# Altium schematic sheet NFC_Sheet.SchDoc
size 420 x 297 mm
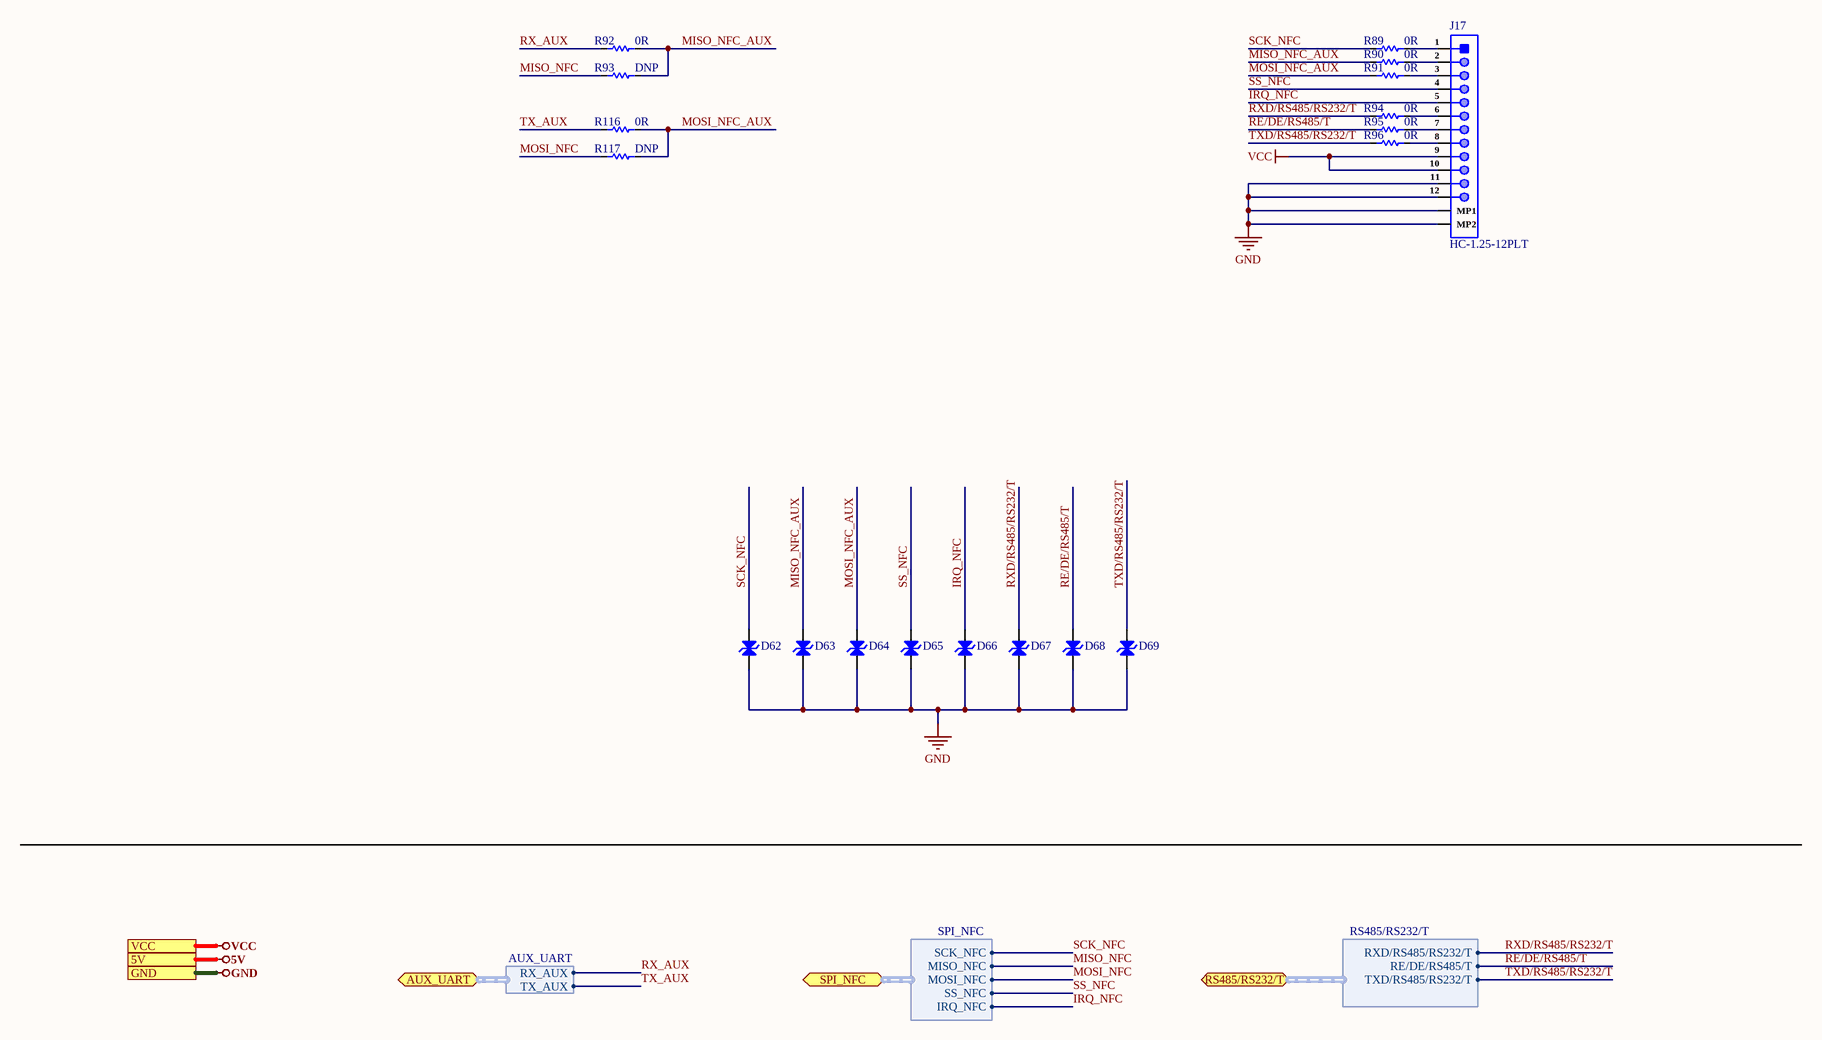
[diagram p0: NFC_Sheet.SchDoc]

## Parts
D62  LESD8D3.3CAT5G  [SOD-882 Bi Directional]  (value not drawn)
D63  LESD8D3.3CAT5G  [SOD-882 Bi Directional]  (value not drawn)
D64  LESD8D3.3CAT5G  [SOD-882 Bi Directional]  (value not drawn)
D65  LESD8D3.3CAT5G  [SOD-882 Bi Directional]  (value not drawn)
D66  LESD8D3.3CAT5G  [SOD-882 Bi Directional]  (value not drawn)
D67  LESD8D3.3CAT5G  [SOD-882 Bi Directional]  (value not drawn)
D68  LESD8D3.3CAT5G  [SOD-882 Bi Directional]  (value not drawn)
D69  LESD8D3.3CAT5G  [SOD-882 Bi Directional]  (value not drawn)
J17  HC-1.25-12PLT  [HC-1.25-12PLT]
R89  0R  [Res-0603]
R90  0R  [Res-0603]
R91  0R  [Res-0603]
R92  0R  [Res-0603]
R93  DNP  [Res-0603]
R94  0R  [Res-0603]
R95  0R  [Res-0603]
R96  0R  [Res-0603]
R116  0R  [Res-0603]
R117  DNP  [Res-0603]

## Ports
5V, AUX_UART (bidir, harness AUX_UART), GND, RS485/RS232/T (bidir, harness RS485/RS232/T), SPI_NFC (bidir, harness SPI_NFC), VCC

## Harnesses
AUX_UART: RX_AUX, TX_AUX
SPI_NFC: MISO_NFC, MOSI_NFC, SS_NFC, IRQ_NFC, SCK_NFC
RS485/RS232/T: RE/DE/RS485/T, TXD/RS485/RS232/T, RXD/RS485/RS232/T

## Nets
5V: port 5V
GND: D62.1(A) D63.1(A) D64.1(A) D65.1(A) D66.1(A) D67.1(A) D68.1(A) D69.1(A) J17.11 J17.12 J17.MP1 J17.MP2 ; port GND
VCC: J17.9 J17.10 ; port VCC
IRQ_NFC: D66.2(A) J17.5 ; port SPI_NFC.IRQ_NFC
MISO_NFC: R93.1 ; port SPI_NFC.MISO_NFC
MISO_NFC_AUX: D63.2(A) R90.1 R92.2 R93.2
MOSI_NFC: R117.1 ; port SPI_NFC.MOSI_NFC
MOSI_NFC_AUX: D64.2(A) R91.1 R116.2 R117.2
RE/DE/RS485/T: D68.2(A) R95.1 ; port RS485/RS232/T.RE/DE/RS485/T
RX_AUX: R92.1 ; port AUX_UART.RX_AUX
RXD/RS485/RS232/T: D67.2(A) R94.1 ; port RS485/RS232/T.RXD/RS485/RS232/T
SCK_NFC: D62.2(A) R89.1 ; port SPI_NFC.SCK_NFC
SS_NFC: D65.2(A) J17.4 ; port SPI_NFC.SS_NFC
TX_AUX: R116.1 ; port AUX_UART.TX_AUX
TXD/RS485/RS232/T: D69.2(A) R96.1 ; port RS485/RS232/T.TXD/RS485/RS232/T
NetJ17_1: J17.1 R89.2
NetJ17_2: J17.2 R90.2
NetJ17_3: J17.3 R91.2
NetJ17_6: J17.6 R94.2
NetJ17_7: J17.7 R95.2
NetJ17_8: J17.8 R96.2

## Notes on the sheet
- File:
- Title:
- Date:
- Page
- Num:
- Total:
- Drawn By: Huzaifa Ali

## Library data of the parts
D62-D69 = LESD8D3.3CAT5G: 5V 10V 3.3V Bi-Directional SOD-882 ESD Protection Devices ROHS; Manufacturer: LRC; Manufacturer Part Number: LESD8D3.3CAT5G; Package: SOD-882; LCSC Part Number: C172409; Item Type: Protection Device; ComponentLink1Description: LCSC; ComponentLink1URL: https://www.lcsc.com/product-detail/span-style-background-color-ff0-ESD-span-Protection-Devices_LRC-LESD8D3-3CAT5G_C172409.html
J17 = HC-1.25-12PLT: 1x12P 12P PicoBlade(MX 1.25) Tin 12 -25℃~+85℃ 2A 1 1.25mm Brass Surface Mount,Vertical SMD,P=1.25mm Wire To Board Connector ROHS; Manufacturer: HCTL; Manufacturer Part Number: HC-1.25-12PLT; Package: SMD,P=1.25mm; LCSC Part Number: C2937190; Item Type: Wire To Board Connector; ComponentLink1Description: LCSC; ComponentLink1URL: https://lcsc.com/product-detail/Wire-To-Board-Connector_HCTL-HC-1-25-12PLT_C2937190.html?s_z=n_1.25-12plt
R89-R96 R116 R117 = RC0603JR-070RL: RES 0 OHM JUMPER 1/10W 0603; Manufacturer: Yageo; Resistance: 0mR; Tolerance: 1%; Power Rating: 100mW; Voltage Rating (DC): 50V; Temperature Coefficient: 200ppm/°C; Resistance Tolerance: 5%; Item Type: Resistor; Supplier 1: Digi-Key; Manufacturer Part Number: RC0603JR-070RL; RoHS: Yes; Category: Chip SMD Resistors; Stock 1: 18081776; Pricing 1: 1=0.10000, 10=0.01700, 25=0.01240, 50=0.00960, 100=0.00700, 250=0.00536, 500=0.00430, 1000=0.00316 (USD); Case/Package: 0603; Number of Pins: 2; Contact Plating: Tin,Matte; Case Code (Imperial): 0603; Case Code (Metric): 1608; Size Code: 0603; Min Operating Temperature: -55°C; Max Operating Temperature: 155°C; Resistor Type: Thick Film; Packaging: Tape and Reel; Termination: SMD/SMT; Series: RC; Technology: THICK FILM; Package Quantity: 5000; Voltage Rating: 50V; Features: Moisture Resistant; Max Power Dissipation: 100mW; Number of Terminations: 2; Construction: Rectangular; Length: 1.6mm; Width: 0.8mm; Height: 0.45mm; Depth: 0.8mm; Radiation Hardening: No; Reach SVHC Compliant: No SVHC; Lead Free: Lead Free; RoHS Compliant: Yes; Military Standard: Not; Supplier Part Number 1: 311-0.0GRCT-ND; LCSC Part Number: C95177